# Altium schematic sheet VBAT.SchDoc
size Letter; SheetNumber: 5; SheetTotal: 15
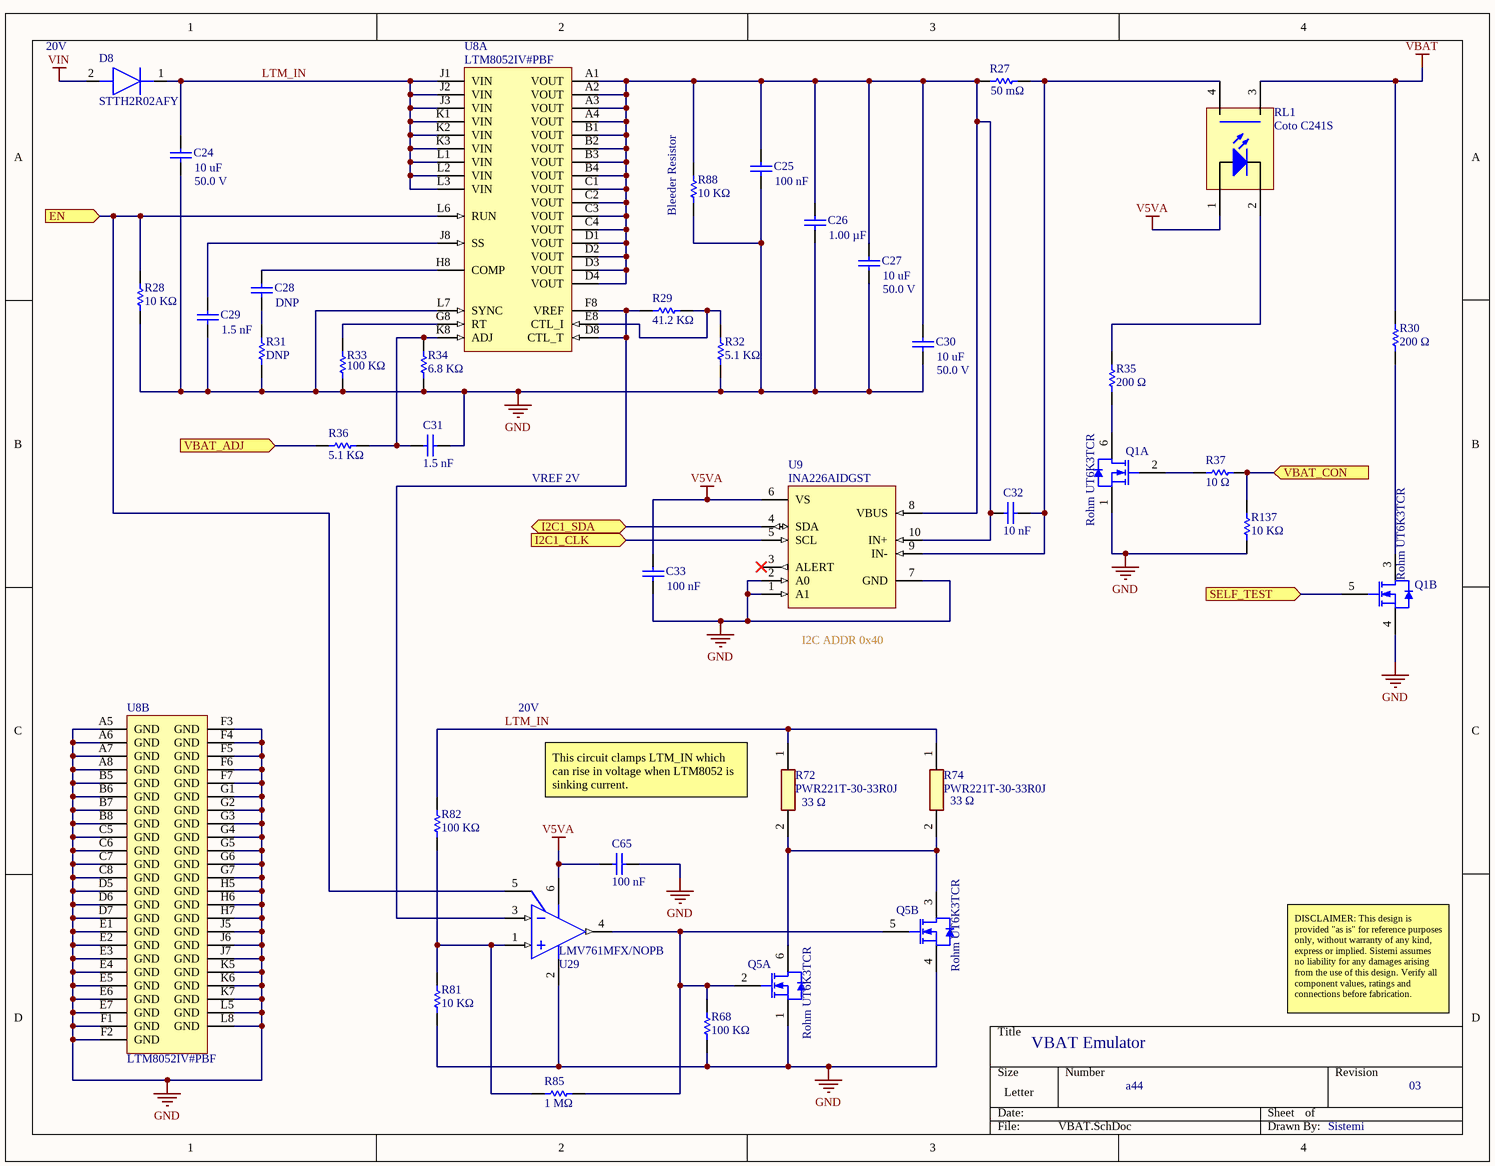
[diagram p0: VBAT.SchDoc]

## Parts
C24  Capacitance: 10 uF  Voltage Rating (DC): 50.0 V  [CAPC3216X180X55LL20T25]  (hidden comment: Murata GRM31CR61H106KA12L)
C25  Capacitance: 100 nF  [CAPC1005X56X25NL10T15]  (hidden comment: Samsung CL05B104KO5NNNC)
C26  Capacitance: 1.00 µF  [CAPC1608X90X35NL15T15]  (hidden comment: Samsung CL10B105KA8NNNC)
C27  Capacitance: 10 uF  Voltage Rating (DC): 50.0 V  [CAPC3216X180X55LL20T25]  (hidden comment: Murata GRM31CR61H106KA12L)
C28  Capacitance: DNP  [CAPC1608X90X35ML15T15]  (hidden comment: Generic CAP 0603)
C29  Capacitance: 1.5 nF  [CAPC1608X90X35ML15T15]  (hidden comment: Generic CAP 0603)
C30  Capacitance: 10 uF  Voltage Rating (DC): 50.0 V  [CAPC3216X180X55LL20T25]  (hidden comment: Murata GRM31CR61H106KA12L)
C31  Capacitance: 1.5 nF  [CAPC1608X90X35ML15T15]  (hidden comment: Generic CAP 0603)
C32  Capacitance: 10 nF  [CAPC1005X56X25NL10T15]  (hidden comment: 10 nF,±10%,25V,CGO,0402)
C33  Capacitance: 100 nF  [CAPC1005X56X25NL10T15]  (hidden comment: Samsung CL05B104KO5NNNC)
C65  Capacitance: 100 nF  [CAPC1005X56X25NL10T15]  (hidden comment: Samsung CL05B104KO5NNNC)
D8  STTH2R02AFY  [SODFL4724X103N]
Q1  Rohm UT6K3TCR  [DFN2020-8D]  (parts A,B of 2)
Q5  Rohm UT6K3TCR  [DFN2020-8D]  (parts A,B of 2)
R27  Resistance: 50 mΩ  [RESC1608X55X30ML15T15]  (hidden comment: Generic RES 0603)
R28  Resistance: 10 KΩ  [RESC1608X55X30ML15T15]  (hidden comment: Generic RES 0603)
R29  Resistance: 41.2 KΩ  [RESC1608X55X30LL15T15]  (hidden comment: Generic RES 0603)
R30  Resistance: 200 Ω  [RESC1608X55X30ML15T15]  (hidden comment: Generic RES 0603)
R31  Resistance: DNP  [RESC1608X55X30ML15T15]  (hidden comment: Generic RES 0603)
R32  Resistance: 5.1 KΩ  [RESC1608X55X30ML15T15]  (hidden comment: Generic RES 0603)
R33  Resistance: 100 KΩ  [RESC1005X40X25NL05T05]  (hidden comment: 100 KΩ,±1%,0402)
R34  Resistance: 6.8 KΩ  [RESC1608X55X30ML15T15]  (hidden comment: Generic RES 0603)
R35  Resistance: 200 Ω  [RESC1608X55X30ML15T15]  (hidden comment: Generic RES 0603)
R36  Resistance: 5.1 KΩ  [RESC1608X55X30ML15T15]  (hidden comment: Generic RES 0603)
R37  Resistance: 10 Ω  [RESC1005X40X25NL05T05]  (hidden comment: 10 Ω,±1%,0402)
R68  Resistance: 100 KΩ  [RESC1005X40X25NL05T05]  (hidden comment: 100 KΩ,±1%,0402)
R72  PWR221T-30-33R0J  Resistance: 33 Ω  [PWR221T3033R0J]
R74  PWR221T-30-33R0J  Resistance: 33 Ω  [PWR221T3033R0J]
R81  Resistance: 10 KΩ  [RESC1608X55X30LL15T15]  (hidden comment: Generic RES 0603)
R82  Resistance: 100 KΩ  [RESC1005X40X25NL05T05]  (hidden comment: 100 KΩ,±1%,0402)
R85  Resistance: 1 MΩ  [RESC1005X40X25NL05T05]  (hidden comment: 1 MΩ,±1%,0402)
R88  Resistance: 10 KΩ  [RESC1608X55X30LL15T15]  (hidden comment: Generic RES 0603)
R137  Resistance: 10 KΩ  [RESC1608X55X30LL15T15]  (hidden comment: Generic RES 0603)
RL1  Coto C241S  [PCB-o1m8470la7x8r6xoffbd-1]
U8  LTM8052IV#PBF  [LT-LGA-81-15000X11250X2820_V]  (parts A,B of 2)
U9  INA226AIDGST  [TSSOP10]
U29  LMV761MFX/NOPB  [MF06A_N]

## Ports
EN (in), I2C1_CLK (in), I2C1_SDA (bidir), SELF_TEST (in), VBAT_ADJ (in), VBAT_CON (in)

## Nets
3: Q1.8(D) Q5.8(D)
6: Q1.7(D) Q5.7(D)
GND: C24.1 C25.1 C26.1 C27.1 C29.1 C30.1 C31.1 C33.1 C65.1 Q1.1(S) Q1.4(S) Q5.1(S) Q5.4(S) R28.1 R31.2 R32.1 R33.1 R34.1 R68.2 R81.1 R88.1 R137.1 U8.A5(GND) U8.A6(GND) U8.A7(GND) U8.A8(GND) U8.B5(GND) U8.B6(GND) U8.B7(GND) U8.B8(GND) U8.C5(GND) U8.C6(GND) U8.C7(GND) U8.C8(GND) U8.D5(GND) U8.D6(GND) U8.D7(GND) U8.E1(GND) U8.E2(GND) U8.E3(GND) U8.E4(GND) U8.E5(GND) U8.E6(GND) U8.E7(GND) U8.F1(GND) U8.F2(GND) U8.F3(GND) U8.F4(GND) U8.F5(GND) U8.F6(GND) U8.F7(GND) U8.G1(GND) U8.G2(GND) U8.G3(GND) U8.G4(GND) U8.G5(GND) U8.G6(GND) U8.G7(GND) U8.H5(GND) U8.H6(GND) U8.H7(GND) U8.J5(GND) U8.J6(GND) U8.J7(GND) U8.K5(GND) U8.K6(GND) U8.K7(GND) U8.L5(GND) U8.L7(SYNC) U8.L8(GND) U9.1(A1) U9.2(A0) U9.7(GND) U29.2(V-)
V5VA: C33.2 C65.2 RL1.1(A) U9.6(VS) U29.6(V+)
VBAT: R30.2 RL1.3(S)
VIN: D8.2(A)
EN: R28.2 U8.L6(RUN) U29.5(~{SD}) ; port EN
I2C1_CLK: U9.5(SCL) ; port I2C1_CLK
I2C1_SDA: U9.4(SDA) ; port I2C1_SDA
LTM_IN: C24.2 D8.1(K) R72.1 R74.1 R82.1 U8.J1(VIN) U8.J2(VIN) U8.J3(VIN) U8.K1(VIN) U8.K2(VIN) U8.K3(VIN) U8.L1(VIN) U8.L2(VIN) U8.L3(VIN)
SELF_TEST: Q1.5(G) ; port SELF_TEST
VBAT_ADJ: R36.2 ; port VBAT_ADJ
VBAT_CON: R37.1 R137.2 ; port VBAT_CON
NetC25_2: C25.2 C26.2 C27.2 C30.2 C32.2 R27.1 R88.2 U8.A1(VOUT) U8.A2(VOUT) U8.A3(VOUT) U8.A4(VOUT) U8.B1(VOUT) U8.B2(VOUT) U8.B3(VOUT) U8.B4(VOUT) U8.C1(VOUT) U8.C2(VOUT) U8.C3(VOUT) U8.C4(VOUT) U8.D1(VOUT) U8.D2(VOUT) U8.D3(VOUT) U8.D4(VOUT) U9.8(VBUS) U9.10(IN+)
NetC28_1: C28.1 R31.1
NetC28_2: C28.2 U8.H8(COMP)
NetC29_2: C29.2 U8.J8(SS)
NetC31_2: C31.2 R34.2 R36.1 U8.K8(ADJ)
NetC32_1: C32.1 R27.2 RL1.4(D) U9.9(IN-)
NetQ1_2: Q1.2(G) R37.2
NetQ1_3: Q1.3(D) R30.1
NetQ1_6: Q1.6(D) R35.1
NetQ5_2: Q5.2(G) Q5.5(G) R68.1 R85.1 U29.4(OUT)
NetQ5_3: Q5.3(D) Q5.6(D) R72.2 R74.2
NetR29_1: R29.1 R32.2 U8.E8(CTL_I)
NetR29_2: R29.2 U8.D8(CTL_T) U8.F8(VREF) U29.3(IN-)
NetR33_2: R33.2 U8.G8(RT)
NetR35_2: R35.2 RL1.2(K)
NetR81_2: R81.2 R82.2 R85.2 U29.1(IN+)

Not connected (* = marked no-connect by the designer): U9 3(ALERT)*

## Notes on the sheet
- (near D8) 20V
- (near R88) Bleeder Resistor
- VREF 2V
- (near U9) I2C ADDR 0x40
- 20V
- (near R72) This circuit clamps LTM_IN which can rise in voltage when LTM8052 is sinking current.
- VBAT Emulator
- DISCLAIMER: This design is provided "as is" for reference purposes only, without warranty of any kind, express or implied. Sistemi assumes no liability for any damages arising from the use of this design. Verify all component values, ratings and connections before fabrication.
- a44
- 03
- Sistemi

## Library data of the parts
C24 C27 C30 = CMP-3554908-2: Multilayer Ceramic Capacitors MLCC - SMD/SMT 1206 10uF 50volt X5R +/-10%; Manufacturer Part Number: CL31B106KBHNNNE; Capacitance Tolerance: ±10%; Case/Package (SI): 3216; Lead-Free Status: Lead Free; Dielectric Characteristic: X5R; Lifecycle Status: Active; Mounting Style: Surface Mount; Number of Pins: 2; Octopart Url: https://octopart.com/grm31cr61h106ka12l-murata-18903335; OctopartID: fd8535afa9c42242; Packaging: Cut Tape (CT); REACH SVHC Compliance: No SVHC; RoHS: Compliant; Size-Length: 0.0032 m; Size-Thickness: 0.0016 m; Size-Width: 0.0016 m
C25 C33 C65 = CMP-bf2276a55d9a60e5-19: Ceramic capacitor SMD-0402 100nF /16V X7R# K +-10%, Samsung, RoHS; Dielectric Characteristic: X7R; Lead-Free Status: Lead Free; Voltage Rating (DC): 16.0 V; Capacitance Tolerance: ±10%; Mounting Style: Surface Mount; Case/Package: 0402; OctopartID: 0755ced2c795d892; Footprint: PCB-0002-00476-3; Octopart URL: https://octopart.com/cl05b104ko5nnnc-samsung-9299366; RoHS: Compliant; Manufacturer Part Number: CL05B104KO5NNNC
C26 = CMP-7473528-5: CL Series 0603 1 uF 25 V ±10 % X7R Surface Mount Multilayer Ceramic Capacitor; Manufacturer Part Number: UMK107AB7105KA-T; Lead-Free Status: Lead Free; Capacitance Tolerance: ±10%; Voltage Rating (DC): 25.0 V; RoHS: Compliant; Mounting Style: Surface Mount; Footprint: PCB-0002-00062-3; Octopart URL: http://octopart.com/cl10b105ka8nnnc-samsung-19831597; Case/Package: 0603; OctopartID: ce7a065e703111bd; Dielectric Characteristic: X7R
C28 = CMP-7473528-7: Generic CAP 0603, =Capacitance+','+Tolerance+','+Voltage+','+Dielectric; Manufacturer Part Number: TBD; Voltage: 25V; Dielectric: X7R; Tolerance: ±10%; Lead-Free Status: Lead Free; RoHS: Compliant; Footprint: PCB-0002-00062-3; OctopartID: ce7a065e703111bd; Mounting Style: Surface Mount; Octopart URL: TBD; Case: 0603
C29 C31 = CMP-7473528-7: Generic CAP 0603, =Capacitance+','+Tolerance+','+Voltage+','+Dielectric; Manufacturer Part Number: GRM1885C2A152JA01D; Voltage: 25V; Dielectric: X7R; Tolerance: ±10%; Lead-Free Status: Lead Free; RoHS: Compliant; Footprint: PCB-0002-00062-3; OctopartID: ce7a065e703111bd; Mounting Style: Surface Mount; Octopart URL: TBD; Case: 0603
C32 = CMP-bf2276a55d9a60e5-20: Generic CAP 0402, =Capacitance+','+Tolerance+','+Voltage+','+Dielectric+','+Case; Manufacturer Part Number: GRM1555C1E103JE01J; Lead-Free Status: Lead Free; Octopart URL: TBD; Case: 0402; OctopartID: 0755ced2c795d892; Voltage: 25V; Dielectric: CGO; RoHS: Compliant; Mounting Style: Surface Mount; Tolerance: ±10%; Footprint: PCB-0002-00476-3
D8 = STTH2R02AFY: Diode; Manufacturer_Name: STMicroelectronics; Datasheet Link: https://www.st.com/resource/en/datasheet/stth2r02af-y.pdf; Height: 1.03mm; Manufacturer Part Number: STTH2R02AFY; Mouser Part Number: 511-STTH2R02AFY; Mouser Price/Stock: https://www.mouser.co.uk/ProductDetail/STMicroelectronics/STTH2R02AFY?qs=pZIKbki37pqpUMRfOtxSog%3D%3D; Arrow Part Number: STTH2R02AFY; Arrow Price/Stock: https://www.arrow.com/en/products/stth2r02afy/stmicroelectronics
Q1 Q5 = CMP-7da2b0d499b7a265-2: On a Reel of 3000, Dual N-Channel MOSFET, 5.5 A, 30 V, 8-Pin DFN ROHM UT6K3TCR; Polarity: Dual N-Channel; Footprint: PCB-qj1nrqbgj5udp5r3frdj-1; RoHS: Compliant; OctopartID: 7da2b0d499b7a265; Manufacturer Part Number: UT6K3TCR; Operating Temperature: 150 °C (max); Octopart URL: https://octopart.com/ut6k3tcr-rohm-75284851
R27 = CMP-0800c38b3cf2d7c7-3: Generic RES 0603, =Resistance+','+Tolerance+','+Case; Manufacturer Part Number: WSLP0603R0500FEB; Case/Package (SI): 1608; Lead-Free Status: Lead Free; Power Rating: 63.0 mW; Voltage: 50V; ELV Compliant: Compliant; Tolerance: ±1%; Temperature Coefficient: -50.0 ppm/°C to 50.0 ppm/°C; Octopart URL: TBD; Number of Pins: 2; Mounting Style: Surface Mount; Packaging: Tape & Reel (TR); Lifecycle Status: Active; RoHS: Compliant; Case: 0603; Operating Temperature: -55.0 °C to 125 °C; REACH SVHC Compliance: No SVHC; Footprint: PCB-0002-00066-3; OctopartID: a8e96364fc37772e
R28 R81 R88 R137 = CMP-0800c38b3cf2d7c7-3: Generic RES 0603, =Resistance+','+Tolerance+','+Case; Manufacturer Part Number: MCT06030C1002FP500; Case/Package (SI): 1608; Lead-Free Status: Lead Free; Power Rating: 63.0 mW; Voltage: 50V; ELV Compliant: Compliant; Tolerance: ±1%; Temperature Coefficient: -50.0 ppm/°C to 50.0 ppm/°C; Octopart URL: TBD; Number of Pins: 2; Mounting Style: Surface Mount; Packaging: Tape & Reel (TR); Lifecycle Status: Active; RoHS: Compliant; Case: 0603; Operating Temperature: -55.0 °C to 125 °C; REACH SVHC Compliance: No SVHC; Footprint: PCB-0002-00066-3; OctopartID: a8e96364fc37772e
R29 = CMP-0800c38b3cf2d7c7-3: Generic RES 0603, =Resistance+','+Tolerance+','+Case; Manufacturer Part Number: RT0603BRE0741K2L; Case/Package (SI): 1608; Lead-Free Status: Lead Free; Power Rating: 63.0 mW; Voltage: 50V; ELV Compliant: Compliant; Tolerance: ±1%; Temperature Coefficient: -50.0 ppm/°C to 50.0 ppm/°C; Octopart URL: TBD; Number of Pins: 2; Mounting Style: Surface Mount; Packaging: Tape & Reel (TR); Lifecycle Status: Active; RoHS: Compliant; Case: 0603; Operating Temperature: -55.0 °C to 125 °C; REACH SVHC Compliance: No SVHC; Footprint: PCB-0002-00066-3; OctopartID: a8e96364fc37772e
R30 R35 = CMP-0800c38b3cf2d7c7-3: Generic RES 0603, =Resistance+','+Tolerance+','+Case; Manufacturer Part Number: RT0603FRE10200RL; Case/Package (SI): 1608; Lead-Free Status: Lead Free; Power Rating: 63.0 mW; Voltage: 50V; ELV Compliant: Compliant; Tolerance: ±1%; Temperature Coefficient: -50.0 ppm/°C to 50.0 ppm/°C; Octopart URL: TBD; Number of Pins: 2; Mounting Style: Surface Mount; Packaging: Tape & Reel (TR); Lifecycle Status: Active; RoHS: Compliant; Case: 0603; Operating Temperature: -55.0 °C to 125 °C; REACH SVHC Compliance: No SVHC; Footprint: PCB-0002-00066-3; OctopartID: a8e96364fc37772e
R31 = CMP-0800c38b3cf2d7c7-3: Generic RES 0603, =Resistance+','+Tolerance+','+Case; Manufacturer Part Number: TBD; Case/Package (SI): 1608; Lead-Free Status: Lead Free; Power Rating: 63.0 mW; Voltage: 50V; ELV Compliant: Compliant; Tolerance: ±1%; Temperature Coefficient: -50.0 ppm/°C to 50.0 ppm/°C; Octopart URL: TBD; Number of Pins: 2; Mounting Style: Surface Mount; Packaging: Tape & Reel (TR); Lifecycle Status: Active; RoHS: Compliant; Case: 0603; Operating Temperature: -55.0 °C to 125 °C; REACH SVHC Compliance: No SVHC; Footprint: PCB-0002-00066-3; OctopartID: a8e96364fc37772e
R32 R36 = CMP-0800c38b3cf2d7c7-3: Generic RES 0603, =Resistance+','+Tolerance+','+Case; Manufacturer Part Number: RT0603FRE075K1L; Case/Package (SI): 1608; Lead-Free Status: Lead Free; Power Rating: 63.0 mW; Voltage: 50V; ELV Compliant: Compliant; Tolerance: ±1%; Temperature Coefficient: -50.0 ppm/°C to 50.0 ppm/°C; Octopart URL: TBD; Number of Pins: 2; Mounting Style: Surface Mount; Packaging: Tape & Reel (TR); Lifecycle Status: Active; RoHS: Compliant; Case: 0603; Operating Temperature: -55.0 °C to 125 °C; REACH SVHC Compliance: No SVHC; Footprint: PCB-0002-00066-3; OctopartID: a8e96364fc37772e
R33 R68 R82 = CMP-3902036-3: Generic RES 0402, =Resistance+','+Tolerance+','+Case; Manufacturer Part Number: RT0402FRE07100KL; Lead-Free Status: Lead Free; Voltage: 50.0 V; Power: 0.063 W; Mounting Style: Surface Mount; RoHS: Compliant; Number of Pins: 2; Tolerance: ±1%; Octopart Url: TBD; Case: 0402; OctopartID: 26dced8948c2f91b
R34 = CMP-0800c38b3cf2d7c7-3: Generic RES 0603, =Resistance+','+Tolerance+','+Case; Manufacturer Part Number: RT0603FRE076K8L; Case/Package (SI): 1608; Lead-Free Status: Lead Free; Power Rating: 63.0 mW; Voltage: 50V; ELV Compliant: Compliant; Tolerance: ±1%; Temperature Coefficient: -50.0 ppm/°C to 50.0 ppm/°C; Octopart URL: TBD; Number of Pins: 2; Mounting Style: Surface Mount; Packaging: Tape & Reel (TR); Lifecycle Status: Active; RoHS: Compliant; Case: 0603; Operating Temperature: -55.0 °C to 125 °C; REACH SVHC Compliance: No SVHC; Footprint: PCB-0002-00066-3; OctopartID: a8e96364fc37772e
R37 = CMP-3902036-3: Generic RES 0402, =Resistance+','+Tolerance+','+Case; Manufacturer Part Number: RT0402FRE0710RL; Lead-Free Status: Lead Free; Voltage: 50.0 V; Power: 0.063 W; Mounting Style: Surface Mount; RoHS: Compliant; Number of Pins: 2; Tolerance: ±1%; Octopart Url: TBD; Case: 0402; OctopartID: 26dced8948c2f91b
R72 R74 = PWR221T-30-33R0J: Resistor; Manufacturer_Name: Bourns; Datasheet Link: https://www.bourns.com/docs/Product-Datasheets/pwr221t-30.pdf; Height: 19.3mm; Manufacturer Part Number: PWR221T-30-33R0J; Mouser Part Number: 652-PWR221T-30-33R0J; Mouser Price/Stock: https://www.mouser.com/Search/Refine.aspx?Keyword=652-PWR221T-30-33R0J
R85 = CMP-3902036-3: Generic RES 0402, =Resistance+','+Tolerance+','+Case; Lead-Free Status: Lead Free; Voltage: 50.0 V; Power: 0.063 W; Mounting Style: Surface Mount; RoHS: Compliant; Number of Pins: 2; Tolerance: ±1%; Octopart Url: TBD; Case: 0402; OctopartID: 26dced8948c2f91b
RL1 = CMP-147564696-2: Coto Mosfet - 1 Form A, 5A, 20V Max/ Tape-Reel; OctopartID: 147564696; Manufacturer Part Number: C241S; Octopart Url: https://octopart.com/c241s-coto-147564696
U8 = CMP-1600243-2: 36 VIN, 5 A, 2-Quadrant CVCC Step-Down uModule Regulator, 81-pin LGA, -40 to 125 degC, Pb-Free, Tray; Number of Outputs: 1; Output Current: 5.0 A; Output Voltage: 24.0 V; Manufacturer Part Number: LTM8052IV#PBF; Mounting Style: Surface Mount; Number of Pins: 81; Octopart Url: https://octopart.com/ltm8052iv%23pbf-linear+technology-21041704; OctopartID: cd35057efa7b12f2; Packaging: Cut Tape (CT); REACH SVHC Compliance: No SVHC; RoHS: Compliant
U9 = CMP-947c5c4360184bbb-17: 36-V, Bi-Directional, Ultra-High Accuracy, Low-/High-Side, I2C Out Current/Power Monitor w/ Alert 10-VSSOP -40 to 125; Manufacturer Part Number: INA226AIDGST
U29 = CMP-1345124-4: Low Voltage, Precision Comparator with Push-Pull Output, 6-pin SOT-23, Pb-Free; Manufacturer: Texas Instruments; Output Current: 0.04 A; Number of Channels: 1; Lead-Free Status: Lead Free; RoHS: Compliant; OctopartID: 23bbebcbaf88fc7c; Case/Package: SOT; Mounting Style: Surface Mount; Octopart Url: https://octopart.com/lmv761mfx%2Fnopb-texas+instruments-24815957; DigiKey: https://www.digikey.com/en/products/detail/texas-instruments/LMV761MFX-NOPB/1872382; Lifecycle Status: Active; Manufacturer Part Number: LMV761MFX/NOPB